# Altium schematic sheet 201_DC-DC.SchDoc: DC-DC
size A4; Date: xxxxxx; Author: R.Ducuara; DrawnBy: J.Jaramillo; Revision: R1V0; SheetNumber: 4; SheetTotal: 7
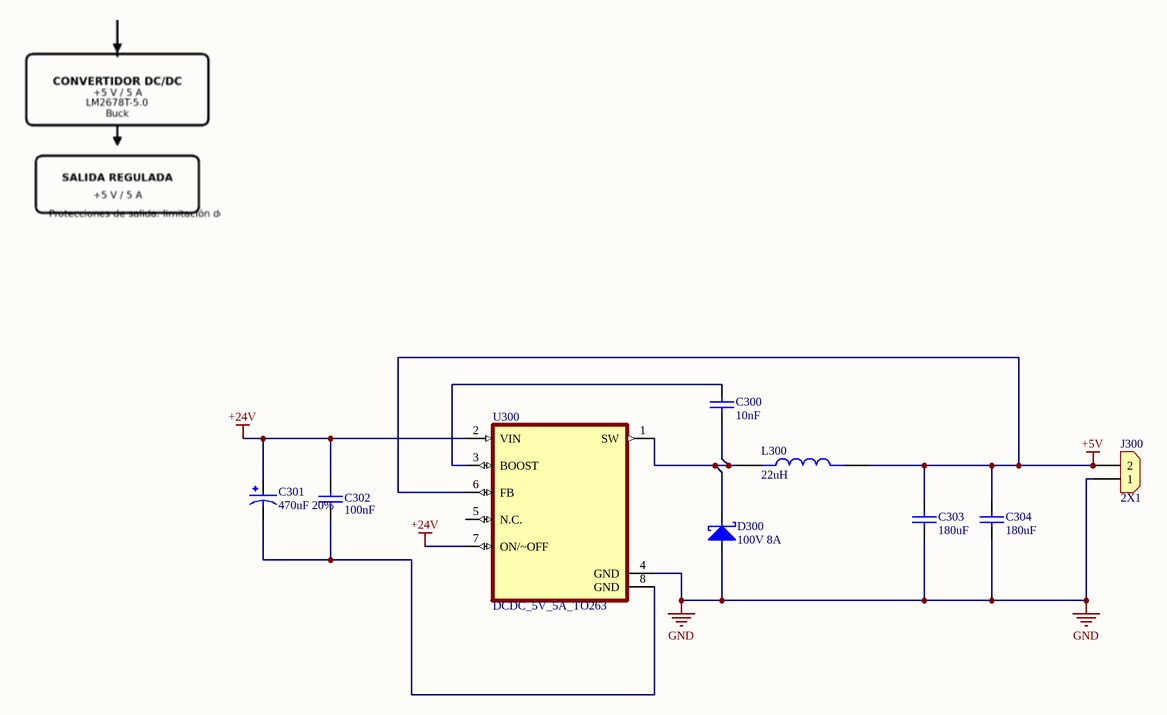
[diagram p0: 201_DC-DC.SchDoc]

## Parts
C300  value 10nF  [0805]  (hidden comment: 10000pF 50V)
C301  470uF 20%  [Cap_470uF_35V_ALUM_RAD]
C302  value 100nF  [1206]  (hidden comment: 100nF 100V)
C303  180uF  [Cap_180uF_16V_ALU_SMD]
C304  180uF  [Cap_180uF_16V_ALU_SMD]
D300  100V 8A  [DO_214AB]
J300  2X1  [CON_2X1_TH_5MM_BAT]
L300  value 22uH  [L_22uH_5A_SMD_FIXED]  (hidden comment: 22uH 5A)
U300  DCDC_5V_5A_TO263  [DCDC_5V_5A_TO263]

## Nets
+5V: C303.1 C304.1 J300.2 L300.2 U300.6(FB)
+24V: C301.P C302.1 U300.2(VIN) U300.7(ON/~OFF)
GND: C303.2 C304.2 D300.2 J300.1 U300.4(GND)
NetC300_1: C300.1 U300.3(BOOST)
NetC300_2: C300.2 D300.1 L300.1 U300.1(SW)
NetC301_N: C301.N C302.2 U300.8(GND)

Not connected (* = marked no-connect by the designer): U300 5(N.C.)

## Notes on the sheet
- Title:
- Project:
- File:
- Revision:
- Date:
- Size:
- A4
- Drawn by:

## Library data of the parts
C300 = Cap_10000pF_0805_50V: CAP CER 10000PF 50V X7R 0805; Manufacturer: Yageo; Manufacturer Part Number: CC0805JRX7R9BB103; Supplier 1: Digi-Key; Supplier Part Number 1: 311-1857-1-ND; Reel stock: N/A; Last modified by: J.Jaramillo; Last modified date: 20240309; ComponentLink1Description: Digi-Key; ComponentLink1URL: https://www.digikey.com/product-detail/en/yageo/CC0805JRX7R9BB103/311-1857-1-ND/5195759
C301 = Cap_470uF_35V_ALUM_RAD: CAP ALUM 470UF 20% 35V RADIAL TH; Manufacturer: Panasonic Industry; Manufacturer Part Number: ECA-1VM471B; Supplier 1: Digi-Key; Supplier Part Number 1: 10-ECA-1VM471BCT-ND; Last modified by: R.Ducuara; Last modified date: 20261121; Value: 470uF
C302 = Cap_0.1uF_1206_100V: CAP CER 0.1UF 100V X7R 1206; Manufacturer: Samsung Electro-Mechanics; Manufacturer Part Number: CL31B104KCFNNNE; Supplier 1: Digi-Key; Supplier Part Number 1: 1276-1151-1-ND; Last modified by: J.Jaramillo; Last modified date: 20240309; ComponentLink1Description: Digi-Key; ComponentLink1URL: https://www.digikey.com/en/products/detail/samsung-electro-mechanics/CL31B104KCFNNNE/3886809
C303 C304 = Cap_180uF_16V_ALU_SMD: CAP ALUM POLY 180UF 20% 16V SMD; Manufacturer: Würth Elektronik; Manufacturer Part Number: 875075355001; Reel stock: Digikey; Last modified by: R.Ducuara; Last modified date: 20240309; Supplier 1: Newark; Supplier Part Number 1: 875075355001; Value: 180uF
D300 = D_Schottky_100V_8A_DO_214AB: DIODE SCHOTTKY 100V 8A DO214AB; Manufacturer: Micro Commercial Co; Manufacturer Part Number: SK810L-TP; Supplier 1: Digi-key; Supplier Part Number 1: SK810L-TPMSCT-ND; Reel Stock: N/A; Last modified by: J.Jaramillo; Last modified date: 20240310; ComponentLink1Description: Digi-key; ComponentLink1URL: https://www.digikey.com/en/products/detail/micro-commercial-co/SK810L-TP/2650905?s=N4IgTCBcDaIMoGkAcBGADAGQLQBUAKIAugL5A
J300 = Con_2x1_TH_5mm_Battery: Power Connectors ROHS; Manufacturer: Changzhou Amass Elec; Manufacturer Part Number: XT30U-M; Supplier 1: LCSC; Supplier Part Number 1: C99101; Reel Stock: N/A; Last modified by: J.Jaramillo; Last modified date: 20240310; ComponentLink1Description: Digi-Key; ComponentLink1URL: https://lcsc.com/product-detail/Power-Connectors_Changzhou-Amass-Elec-XT30U-M_C99101.html
L300 = L_22uH_5A_SMD_FIXED: 22 µH Blindado Moldeado Inductivo 5 A 74mOhm máx. No estándar; Manufacturer: Abracon LLC; Manufacturer Part Number: AMPLA1004S-220MT; Supplier 1: Digi-Key; Supplier Part Number 1: AMPLA1004S-220MT; Reel Stock: N/A; Last modified by: R.Ducuara; Last modified date: 20261120
U300 = DCDC_5V_5A_TO263: IC REG BUCK 5V 5A TO263; Manufacturer: Texas Instruments; Manufacturer Part Number: LM2678S-5.0; Supplier 1: Digikey; Supplier Part Number 1: LM2678S-5.0-ND; Reel Stock: N/A; Last modified by: R.Ducuara; Last modified date: 20261120